# EasyEDA schematic SCH_FilPilote_8Zones_DIN_2_2026-11-06.json
TITLE: Sheet_1; REV: 1.0; Date: 2026-11-04; Sheet: 1/1; Drawn By: etiennebesace; Company: Your Company
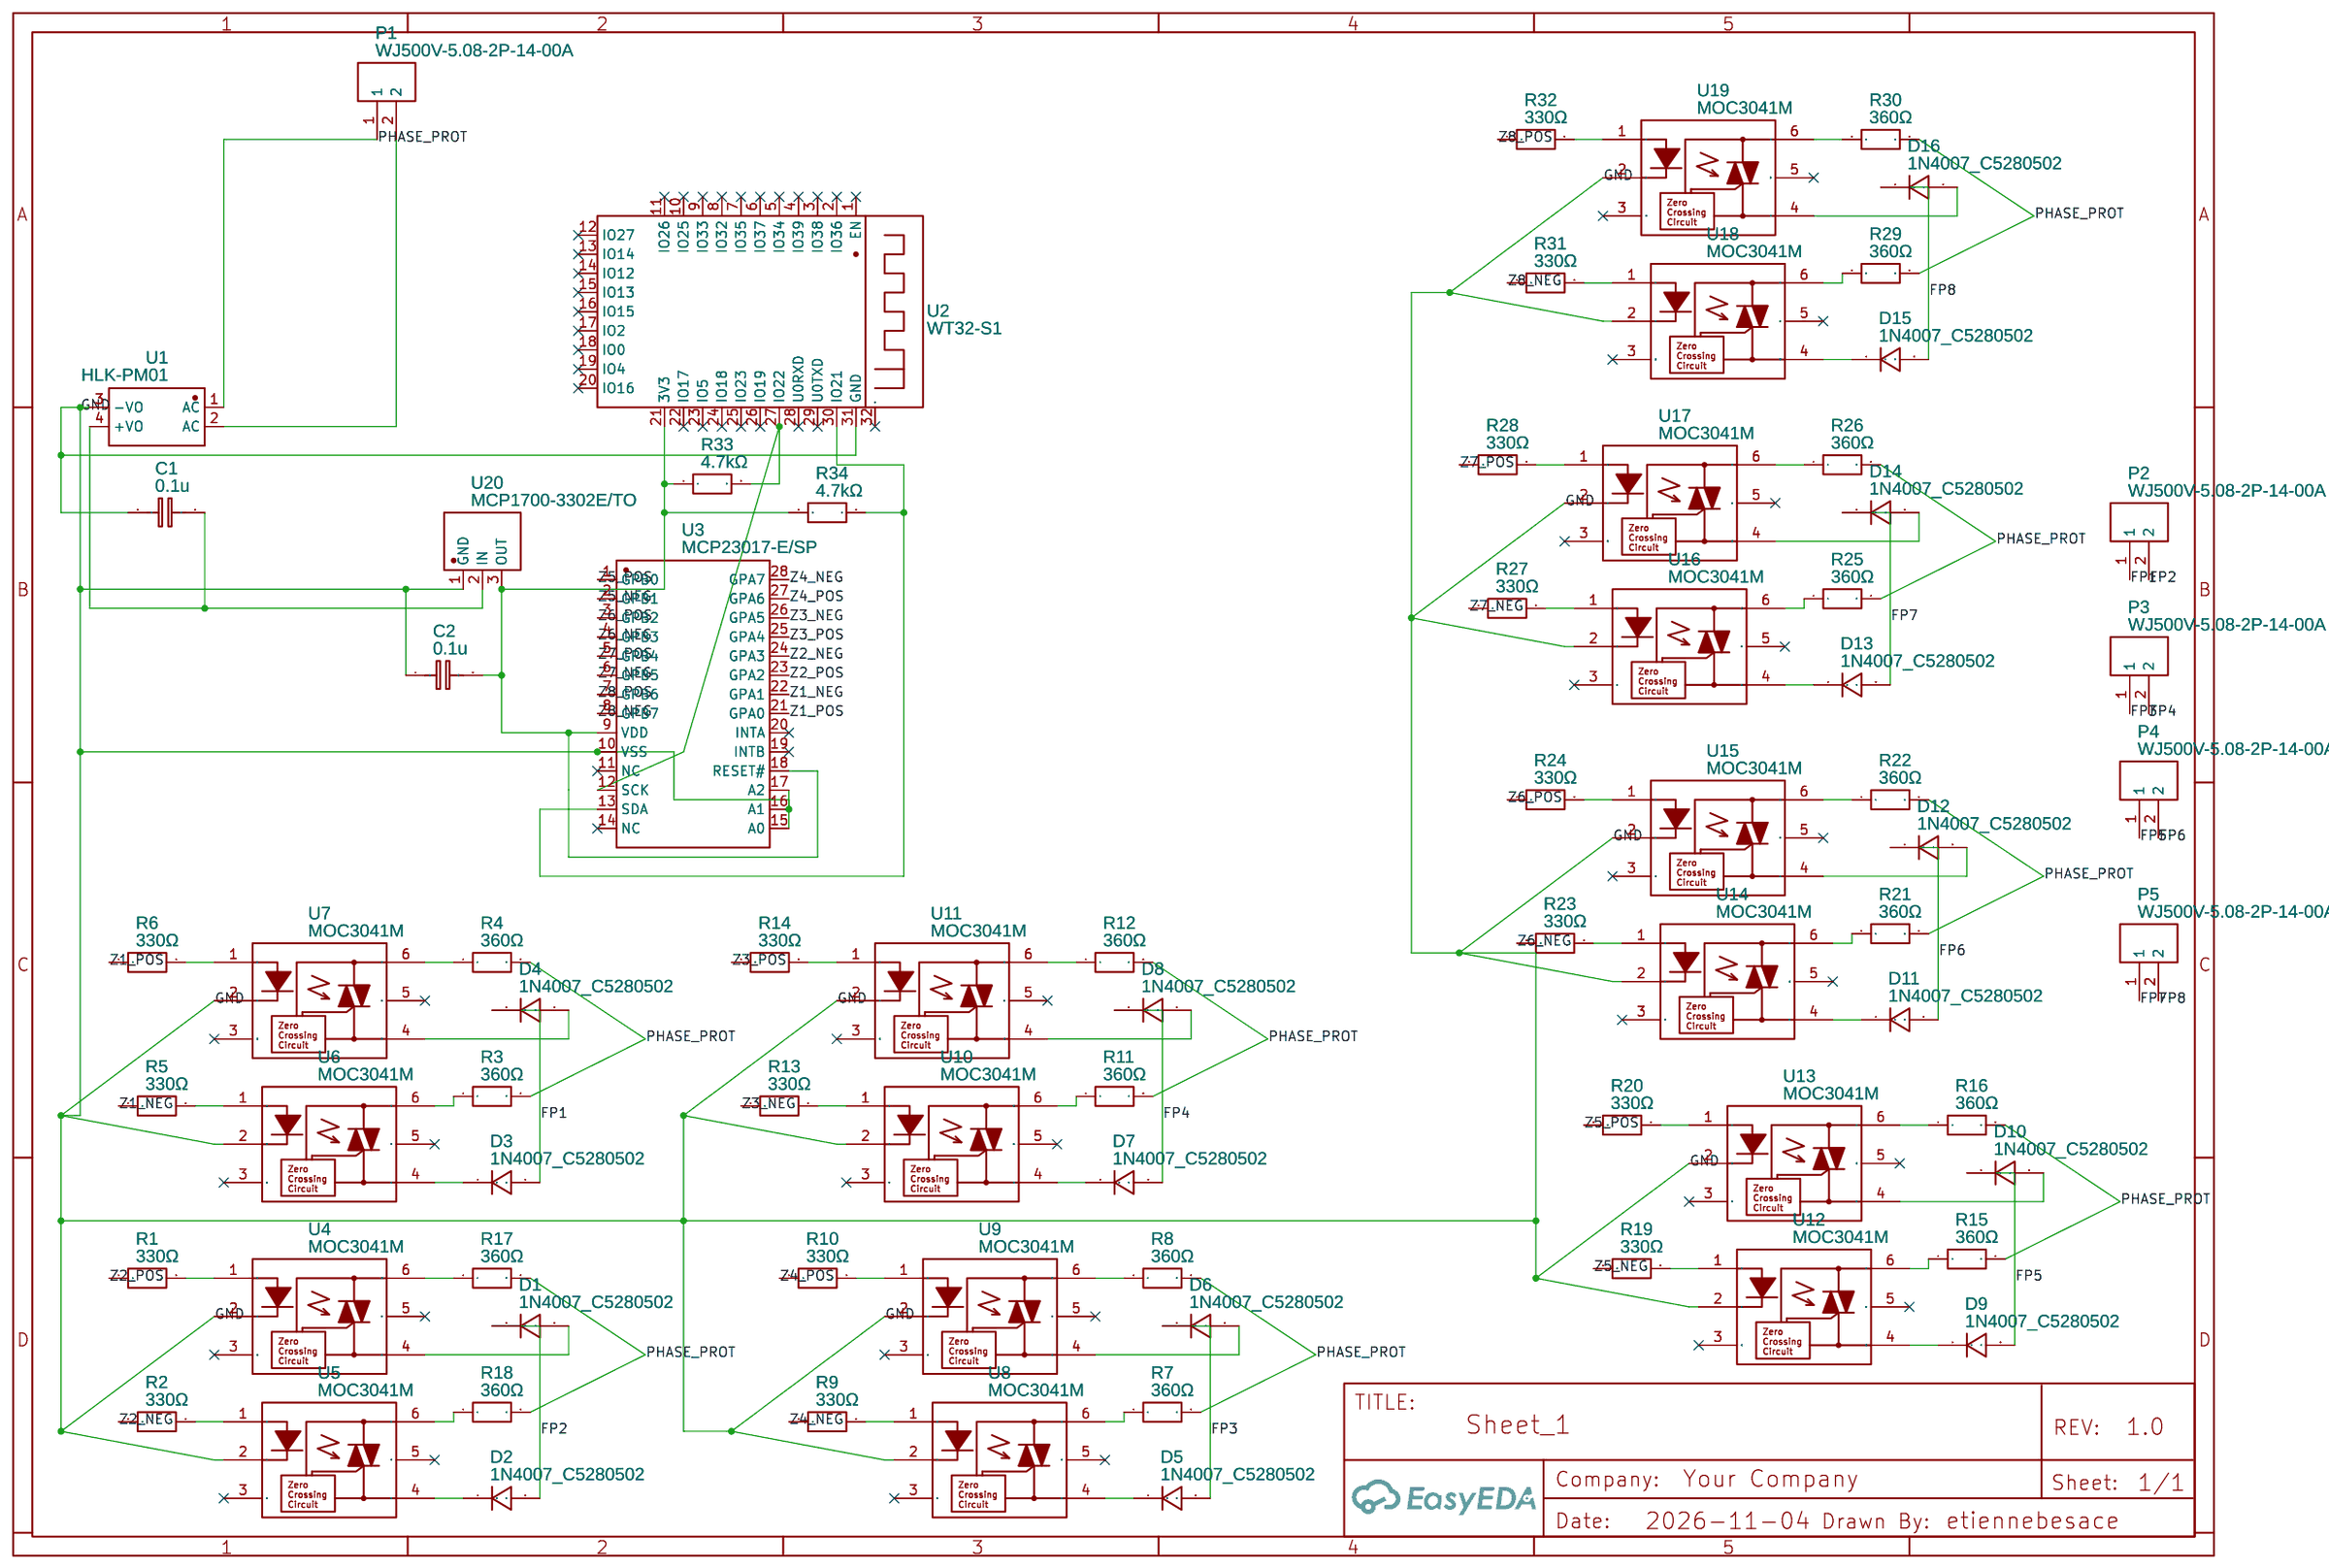
[diagram p0: schematic sheet]

## Parts
C1  0.1u  [RAD-0.2]
C2  0.1u  [RAD-0.2]
D1  1N4007_C5280502  [DO-41_BD2.4-L4.7-P8.70-D0.9-RD]
D2  1N4007_C5280502  [DO-41_BD2.4-L4.7-P8.70-D0.9-RD]
D3  1N4007_C5280502  [DO-41_BD2.4-L4.7-P8.70-D0.9-RD]
D4  1N4007_C5280502  [DO-41_BD2.4-L4.7-P8.70-D0.9-RD]
D5  1N4007_C5280502  [DO-41_BD2.4-L4.7-P8.70-D0.9-RD]
D6  1N4007_C5280502  [DO-41_BD2.4-L4.7-P8.70-D0.9-RD]
D7  1N4007_C5280502  [DO-41_BD2.4-L4.7-P8.70-D0.9-RD]
D8  1N4007_C5280502  [DO-41_BD2.4-L4.7-P8.70-D0.9-RD]
D9  1N4007_C5280502  [DO-41_BD2.4-L4.7-P8.70-D0.9-RD]
D10  1N4007_C5280502  [DO-41_BD2.4-L4.7-P8.70-D0.9-RD]
D11  1N4007_C5280502  [DO-41_BD2.4-L4.7-P8.70-D0.9-RD]
D12  1N4007_C5280502  [DO-41_BD2.4-L4.7-P8.70-D0.9-RD]
D13  1N4007_C5280502  [DO-41_BD2.4-L4.7-P8.70-D0.9-RD]
D14  1N4007_C5280502  [DO-41_BD2.4-L4.7-P8.70-D0.9-RD]
D15  1N4007_C5280502  [DO-41_BD2.4-L4.7-P8.70-D0.9-RD]
D16  1N4007_C5280502  [DO-41_BD2.4-L4.7-P8.70-D0.9-RD]
P1  WJ500V-5.08-2P-14-00A  [CONN-TH_2P-P5.00_WJ500V-5.08-2P]
P2  WJ500V-5.08-2P-14-00A  [CONN-TH_2P-P5.00_WJ500V-5.08-2P]
P3  WJ500V-5.08-2P-14-00A  [CONN-TH_2P-P5.00_WJ500V-5.08-2P]
P4  WJ500V-5.08-2P-14-00A  [CONN-TH_2P-P5.00_WJ500V-5.08-2P]
P5  WJ500V-5.08-2P-14-00A  [CONN-TH_2P-P5.00_WJ500V-5.08-2P]
R1  330Ω  [R_AXIAL-0.3]
R2  330Ω  [R_AXIAL-0.3]
R3  360Ω  [R_AXIAL-0.4]
R4  360Ω  [R_AXIAL-0.4]
R5  330Ω  [R_AXIAL-0.3]
R6  330Ω  [R_AXIAL-0.3]
R7  360Ω  [R_AXIAL-0.4]
R8  360Ω  [R_AXIAL-0.4]
R9  330Ω  [R_AXIAL-0.3]
R10  330Ω  [R_AXIAL-0.3]
R11  360Ω  [R_AXIAL-0.4]
R12  360Ω  [R_AXIAL-0.4]
R13  330Ω  [R_AXIAL-0.3]
R14  330Ω  [R_AXIAL-0.3]
R15  360Ω  [R_AXIAL-0.4]
R16  360Ω  [R_AXIAL-0.4]
R17  360Ω  [R_AXIAL-0.4]
R18  360Ω  [R_AXIAL-0.4]
R19  330Ω  [R_AXIAL-0.3]
R20  330Ω  [R_AXIAL-0.3]
R21  360Ω  [R_AXIAL-0.4]
R22  360Ω  [R_AXIAL-0.4]
R23  330Ω  [R_AXIAL-0.3]
R24  330Ω  [R_AXIAL-0.3]
R25  360Ω  [R_AXIAL-0.4]
R26  360Ω  [R_AXIAL-0.4]
R27  330Ω  [R_AXIAL-0.3]
R28  330Ω  [R_AXIAL-0.3]
R29  360Ω  [R_AXIAL-0.4]
R30  360Ω  [R_AXIAL-0.4]
R31  330Ω  [R_AXIAL-0.3]
R32  330Ω  [R_AXIAL-0.3]
R33  4.7kΩ  [R_AXIAL-0.3]
R34  4.7kΩ  [R_AXIAL-0.3]
U1  HLK-PM01  [PWRM-TH_HLK-PM01]
U2  WT32-S1  [WIFIM-SMD_31P-L22.5-W16.0-P1.27]
U3  MCP23017-E/SP  [DIP-28_L34.6-W7.3-P2.54-LS10.2-BL]
U4  MOC3041M  [DIP-6_L8.5-W6.4-P2.54-LS7.6-BL]
U5  MOC3041M  [DIP-6_L8.5-W6.4-P2.54-LS7.6-BL]
U6  MOC3041M  [DIP-6_L8.5-W6.4-P2.54-LS7.6-BL]
U7  MOC3041M  [DIP-6_L8.5-W6.4-P2.54-LS7.6-BL]
U8  MOC3041M  [DIP-6_L8.5-W6.4-P2.54-LS7.6-BL]
U9  MOC3041M  [DIP-6_L8.5-W6.4-P2.54-LS7.6-BL]
U10  MOC3041M  [DIP-6_L8.5-W6.4-P2.54-LS7.6-BL]
U11  MOC3041M  [DIP-6_L8.5-W6.4-P2.54-LS7.6-BL]
U12  MOC3041M  [DIP-6_L8.5-W6.4-P2.54-LS7.6-BL]
U13  MOC3041M  [DIP-6_L8.5-W6.4-P2.54-LS7.6-BL]
U14  MOC3041M  [DIP-6_L8.5-W6.4-P2.54-LS7.6-BL]
U15  MOC3041M  [DIP-6_L8.5-W6.4-P2.54-LS7.6-BL]
U16  MOC3041M  [DIP-6_L8.5-W6.4-P2.54-LS7.6-BL]
U17  MOC3041M  [DIP-6_L8.5-W6.4-P2.54-LS7.6-BL]
U18  MOC3041M  [DIP-6_L8.5-W6.4-P2.54-LS7.6-BL]
U19  MOC3041M  [DIP-6_L8.5-W6.4-P2.54-LS7.6-BL]
U20  MCP1700-3302E/TO  [TO-92-3_L5.1-W4.1-P1.27-L]

## Library data of the parts
C1 C2 = C_RAD-0.2_EU: Contributor: LCEDA_Lib
D1-D16 = 1N4007_C5280502: Contributor: lcsc; Supplier: LCSC; Supplier Part: C5280502; Manufacturer: XCH(旭昌辉); Manufacturer Part: 1N4007; JLCPCB Part Class: Extended Part
P1-P5 = WJ500V-5.08-2P-14-00A: Supplier: LCSC; Manufacturer: KANGNEX(康奈克斯电气); Manufacturer Part: WJ500V-5.08-2P; Supplier Part: C8465; JLCPCB Part Class: Extended Part
R1-R34 = R_0603_EU: Contributor: LCEDA_Lib
U1 = HLK-PM01: Contributor: LCSC; Supplier: LCSC; Supplier Part: C209903; Manufacturer: HI-LINK(海凌科); JLCPCB Part Class: Extended Part
U2 = WT32-S1: Contributor: LCSC; Supplier: LCSC; Supplier Part: C477832; Manufacturer: Wireless-tag(启明云端); JLCPCB Part Class: Extended Part
U3 = MCP23017-E/SP: Contributor: LCSC; Supplier: LCSC; Supplier Part: C647352; Manufacturer: MICROCHIP(美国微芯); JLCPCB Part Class: Extended Part
U4-U19 = MOC3041M: Supplier: LCSC; Manufacturer: onsemi(安森美); Supplier Part: C8921; JLCPCB Part Class: Extended Part
U20 = MCP1700-3302E/TO: Contributor: LCSC; Supplier: LCSC; Supplier Part: C511277; Manufacturer: MICROCHIP(美国微芯); JLCPCB Part Class: Extended Part

## Nets
GND: C1.1 C2.1 U1.3(-VO) U2.31(GND) U3.10(VSS) U3.15(A0) U3.16(A1) U3.17(A2) U4.2(K) U5.2(K) U6.2(K) U7.2(K) U8.2(K) U9.2(K) U10.2(K) U11.2(K) U12.2(K) U13.2(K) U14.2(K) U15.2(K) U16.2(K) U17.2(K) U18.2(K) U19.2(K) U20.1(GND)
FP1: D3.2 D4.1 P2.1
FP2: D1.1 D2.2 P2.2
FP3: D5.2 D6.1 P3.1
FP4: D7.2 D8.1 P3.2
FP5: D9.2 D10.1 P4.1
FP6: D11.2 D12.1 P4.2
FP7: D13.2 D14.1 P5.1
FP8: D15.2 D16.1 P5.2
PHASE_PROT: P1.1 R3.2 R4.2 R7.2 R8.2 R11.2 R12.2 R15.2 R16.2 R17.2 R18.2 R21.2 R22.2 R25.2 R26.2 R29.2 R30.2 U1.1(AC)
Z1_NEG: R5.1 U3.22(GPA1)
Z1_POS: R6.1 U3.21(GPA0)
Z2_NEG: R2.1 U3.24(GPA3)
Z2_POS: R1.1 U3.23(GPA2)
Z3_NEG: R13.1 U3.26(GPA5)
Z3_POS: R14.1 U3.25(GPA4)
Z4_NEG: R9.1 U3.28(GPA7)
Z4_POS: R10.1 U3.27(GPA6)
Z5_NEG: R19.1 U3.2(GPB1)
Z5_POS: R20.1 U3.1(GPB0)
Z6_NEG: R23.1 U3.4(GPB3)
Z6_POS: R24.1 U3.3(GPB2)
Z7_NEG: R27.1 U3.6(GPB5)
Z7_POS: R28.1 U3.5(GPB4)
Z8_NEG: R31.1 U3.8(GPB7)
Z8_POS: R32.1 U3.7(GPB6)
Net-(C1-2): C1.2 U1.4(+VO) U20.2(IN)
Net-(C2-2): C2.2 R33.1 R34.1 U2.21(3V3) U3.9(VDD) U3.18(RESET#) U20.3(OUT)
Net-(D1-2): D1.2 U4.4(T2)
Net-(D2-1): D2.1 U5.4(T2)
Net-(D3-1): D3.1 U6.4(T2)
Net-(D4-2): D4.2 U7.4(T2)
Net-(D5-1): D5.1 U8.4(T2)
Net-(D6-2): D6.2 U9.4(T2)
Net-(D7-1): D7.1 U10.4(T2)
Net-(D8-2): D8.2 U11.4(T2)
Net-(D9-1): D9.1 U12.4(T2)
Net-(D10-2): D10.2 U13.4(T2)
Net-(D11-1): D11.1 U14.4(T2)
Net-(D12-2): D12.2 U15.4(T2)
Net-(D13-1): D13.1 U16.4(T2)
Net-(D14-2): D14.2 U17.4(T2)
Net-(D15-1): D15.1 U18.4(T2)
Net-(D16-2): D16.2 U19.4(T2)
Net-(P1-2): P1.2 U1.2(AC)
Net-(R1-2): R1.2 U4.1(A)
Net-(R2-2): R2.2 U5.1(A)
Net-(R3-1): R3.1 U6.6(T1)
Net-(R4-1): R4.1 U7.6(T1)
Net-(R5-2): R5.2 U6.1(A)
Net-(R6-2): R6.2 U7.1(A)
Net-(R7-1): R7.1 U8.6(T1)
Net-(R8-1): R8.1 U9.6(T1)
Net-(R9-2): R9.2 U8.1(A)
Net-(R10-2): R10.2 U9.1(A)
Net-(R11-1): R11.1 U10.6(T1)
Net-(R12-1): R12.1 U11.6(T1)
Net-(R13-2): R13.2 U10.1(A)
Net-(R14-2): R14.2 U11.1(A)
Net-(R15-1): R15.1 U12.6(T1)
Net-(R16-1): R16.1 U13.6(T1)
Net-(R17-1): R17.1 U4.6(T1)
Net-(R18-1): R18.1 U5.6(T1)
Net-(R19-2): R19.2 U12.1(A)
Net-(R20-2): R20.2 U13.1(A)
Net-(R21-1): R21.1 U14.6(T1)
Net-(R22-1): R22.1 U15.6(T1)
Net-(R23-2): R23.2 U14.1(A)
Net-(R24-2): R24.2 U15.1(A)
Net-(R25-1): R25.1 U16.6(T1)
Net-(R26-1): R26.1 U17.6(T1)
Net-(R27-2): R27.2 U16.1(A)
Net-(R28-2): R28.2 U17.1(A)
Net-(R29-1): R29.1 U18.6(T1)
Net-(R30-1): R30.1 U19.6(T1)
Net-(R31-2): R31.2 U18.1(A)
Net-(R32-2): R32.2 U19.1(A)
Net-(R33-2): R33.2 U2.27(IO22) U3.12(SCK)
Net-(R34-2): R34.2 U2.30(IO21) U3.13(SDA)

Not connected (* = marked no-connect by the designer): U2 1(EN)* 2(IO36)* 3(IO38)* 4(IO39)* 5(IO34)* 6(IO37)* 7(IO35)* 8(IO32)* 9(IO33)* 10(IO25)* 11(IO26)* 12(IO27)* 13(IO14)* 14(IO12)* 15(IO13)* 16(IO15)* 17(IO2)* 18(IO0)* 19(IO4)* 20(IO16)* 22(IO17)* 23(IO5)* 24(IO18)* 25(IO23)* 26(IO19)* 28(U0RXD)* 29(U0TXD)* 32(PAD)*; U3 11(NC)* 14(NC)* 19(INTB)* 20(INTA)*; U4 3(NC)* 5(NC)*; U5 3(NC)* 5(NC)*; U6 3(NC)* 5(NC)*; U7 3(NC)* 5(NC)*; U8 3(NC)* 5(NC)*; U9 3(NC)* 5(NC)*; U10 3(NC)* 5(NC)*; U11 3(NC)* 5(NC)*; U12 3(NC)* 5(NC)*; U13 3(NC)* 5(NC)*; U14 3(NC)* 5(NC)*; U15 3(NC)* 5(NC)*; U16 3(NC)* 5(NC)*; U17 3(NC)* 5(NC)*; U18 3(NC)* 5(NC)*; U19 3(NC)* 5(NC)*
